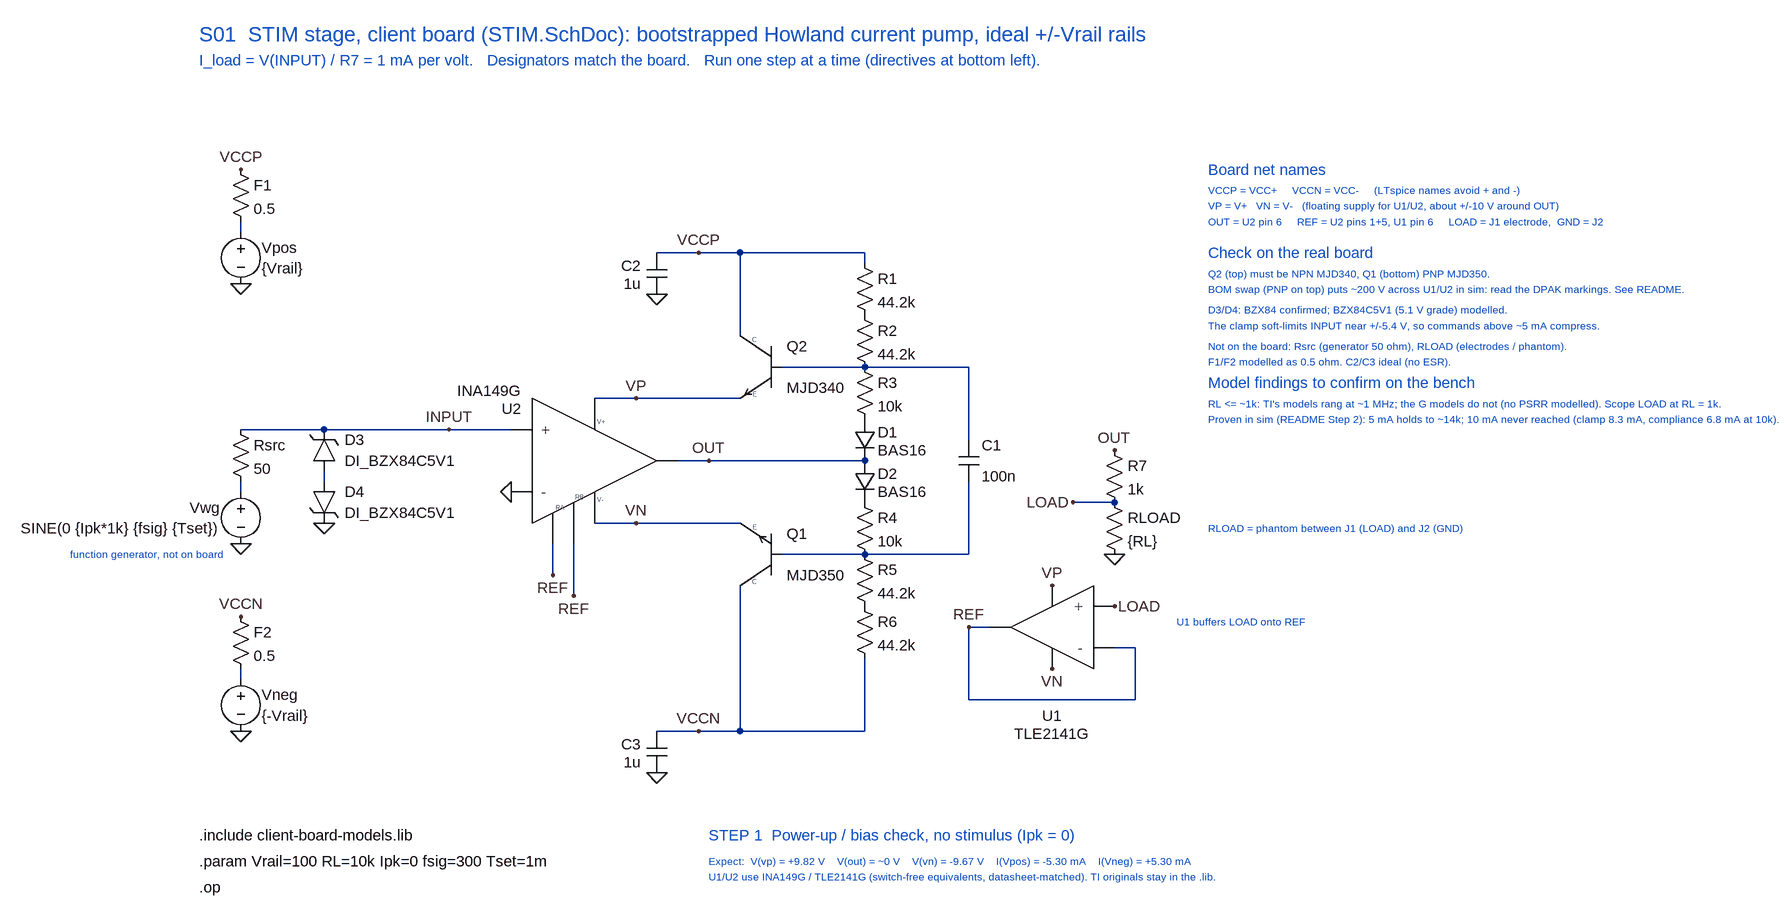
[diagram p0: schematic client-board-model.asc]
client-board-model.asc, the LTspice schematic file:
Version 4
SHEET 1 2400 1500
WIRE 0 -48 0 -32
WIRE 0 272 128 272
WIRE 128 272 320 272
WIRE 320 272 416 272
WIRE 0 352 0 368
WIRE 128 336 128 352
WIRE 0 640 0 656
WIRE 640 0 704 0
WIRE 704 0 768 0
WIRE 768 0 960 0
WIRE 768 0 768 128
WIRE 960 0 960 16
WIRE 640 736 704 736
WIRE 704 736 768 736
WIRE 768 736 960 736
WIRE 768 512 768 736
WIRE 960 624 960 736
WIRE 832 176 960 176
WIRE 832 464 960 464
WIRE 960 176 1120 176
WIRE 1120 176 1120 288
WIRE 1120 352 1120 464
WIRE 1120 464 960 464
WIRE 544 224 608 224
WIRE 608 224 768 224
WIRE 544 416 608 416
WIRE 608 416 768 416
WIRE 672 320 720 320
WIRE 720 320 960 320
WIRE 480 448 480 496
WIRE 512 448 512 528
WIRE 1344 384 1280 384
WIRE 1152 576 1120 576
WIRE 1120 576 1120 688
WIRE 1120 688 1376 688
WIRE 1376 688 1376 608
WIRE 1376 608 1344 608
FLAG 0 -128 VCCP
FLAG 0 48 0
FLAG 320 272 INPUT
FLAG 0 448 0
FLAG 128 416 0
FLAG 0 560 VCCN
FLAG 0 736 0
FLAG 704 0 VCCP
FLAG 640 64 0
FLAG 704 736 VCCN
FLAG 640 800 0
FLAG 416 368 0
FLAG 480 496 REF
FLAG 512 528 REF
FLAG 608 224 VP
FLAG 608 416 VN
FLAG 720 320 OUT
FLAG 1344 304 OUT
FLAG 1280 384 LOAD
FLAG 1344 464 0
FLAG 1344 544 LOAD
FLAG 1248 512 VP
FLAG 1248 640 VN
FLAG 1120 576 REF
SYMBOL res -16 -144 R0
WINDOW 0 36 40 Left 2
WINDOW 3 36 76 Left 2
SYMATTR InstName F1
SYMATTR Value 0.5
SYMBOL voltage 0 -48 R0
WINDOW 0 32 40 Left 2
WINDOW 3 32 72 Left 2
SYMATTR InstName Vpos
SYMATTR Value {Vrail}
SYMBOL res -16 256 R0
WINDOW 0 36 40 Left 2
WINDOW 3 36 76 Left 2
SYMATTR InstName Rsrc
SYMATTR Value 50
SYMBOL voltage 0 352 R0
WINDOW 0 -32 40 Right 2
WINDOW 3 -32 72 Right 2
SYMATTR InstName Vwg
SYMATTR Value SINE(0 {Ipk*1k} {fsig} {Tset})
SYMBOL zener_ka 112 272 R0
WINDOW 0 48 16 Left 2
WINDOW 3 48 48 Left 2
SYMATTR InstName D3
SYMATTR Value DI_BZX84C5V1
SYMBOL zener_ak 112 352 R0
WINDOW 0 48 16 Left 2
WINDOW 3 48 48 Left 2
SYMATTR InstName D4
SYMATTR Value DI_BZX84C5V1
SYMBOL res -16 544 R0
WINDOW 0 36 40 Left 2
WINDOW 3 36 76 Left 2
SYMATTR InstName F2
SYMATTR Value 0.5
SYMBOL voltage 0 640 R0
WINDOW 0 32 40 Left 2
WINDOW 3 32 72 Left 2
SYMATTR InstName Vneg
SYMATTR Value {-Vrail}
SYMBOL cap 624 0 R0
WINDOW 0 -8 20 Right 2
WINDOW 3 -8 48 Right 2
SYMATTR InstName C2
SYMATTR Value 1u
SYMBOL cap 624 736 R0
WINDOW 0 -8 20 Right 2
WINDOW 3 -8 48 Right 2
SYMATTR InstName C3
SYMATTR Value 1u
SYMBOL npn_r 768 128 R0
WINDOW 0 72 16 Left 2
WINDOW 3 72 80 Left 2
SYMATTR InstName Q2
SYMATTR Value MJD340
SYMBOL pnp_r 768 416 R0
WINDOW 0 72 16 Left 2
WINDOW 3 72 80 Left 2
SYMATTR InstName Q1
SYMATTR Value MJD350
SYMBOL res 944 0 R0
WINDOW 0 36 40 Left 2
WINDOW 3 36 76 Left 2
SYMATTR InstName R1
SYMATTR Value 44.2k
SYMBOL res 944 80 R0
WINDOW 0 36 40 Left 2
WINDOW 3 36 76 Left 2
SYMATTR InstName R2
SYMATTR Value 44.2k
SYMBOL res 944 160 R0
WINDOW 0 36 40 Left 2
WINDOW 3 36 76 Left 2
SYMATTR InstName R3
SYMATTR Value 10k
SYMBOL diode 944 256 R0
WINDOW 0 36 20 Left 2
WINDOW 3 36 48 Left 2
SYMATTR InstName D1
SYMATTR Value BAS16
SYMBOL diode 944 320 R0
WINDOW 0 36 20 Left 2
WINDOW 3 36 48 Left 2
SYMATTR InstName D2
SYMATTR Value BAS16
SYMBOL res 944 368 R0
WINDOW 0 36 40 Left 2
WINDOW 3 36 76 Left 2
SYMATTR InstName R4
SYMATTR Value 10k
SYMBOL res 944 448 R0
WINDOW 0 36 40 Left 2
WINDOW 3 36 76 Left 2
SYMATTR InstName R5
SYMATTR Value 44.2k
SYMBOL res 944 528 R0
WINDOW 0 36 40 Left 2
WINDOW 3 36 76 Left 2
SYMATTR InstName R6
SYMATTR Value 44.2k
SYMBOL cap 1104 288 R0
WINDOW 0 36 8 Left 2
WINDOW 3 36 56 Left 2
SYMATTR InstName C1
SYMATTR Value 100n
SYMBOL INA149 448 320 R0
WINDOW 0 -16 -80 Right 2
WINDOW 3 -16 -108 Right 2
SYMATTR InstName U2
SYMATTR Value INA149G
SYMBOL res 1328 288 R0
WINDOW 0 36 40 Left 2
WINDOW 3 36 76 Left 2
SYMATTR InstName R7
SYMATTR Value 1k
SYMBOL res 1328 368 R0
WINDOW 0 36 40 Left 2
WINDOW 3 36 76 Left 2
SYMATTR InstName RLOAD
SYMATTR Value {RL}
SYMBOL TLE2141 1184 576 R0
WINDOW 0 64 136 Center 2
WINDOW 3 64 164 Center 2
SYMATTR InstName U1
SYMATTR Value TLE2141G
TEXT -64 -336 Left 3 S01  STIM stage, client board (STIM.SchDoc): bootstrapped Howland current pump, ideal +/-Vrail rails
TEXT -64 -296 Left 2 I_load = V(INPUT) / R7 = 1 mA per volt.   Designators match the board.   Run one step at a time (directives at bottom left).
TEXT 1488 -128 Left 2 Board net names
TEXT 1488 -96 Left 1 VCCP = VCC+     VCCN = VCC-     (LTspice names avoid + and -)
TEXT 1488 -72 Left 1 VP = V+   VN = V-   (floating supply for U1/U2, about +/-10 V around OUT)
TEXT 1488 -48 Left 1 OUT = U2 pin 6     REF = U2 pins 1+5, U1 pin 6     LOAD = J1 electrode,  GND = J2
TEXT 1488 0 Left 2 Check on the real board
TEXT 1488 32 Left 1 Q2 (top) must be NPN MJD340, Q1 (bottom) PNP MJD350.
TEXT 1488 56 Left 1 BOM swap (PNP on top) puts ~200 V across U1/U2 in sim: read the DPAK markings. See README.
TEXT 1488 88 Left 1 D3/D4: BZX84 confirmed; BZX84C5V1 (5.1 V grade) modelled.
TEXT 1488 112 Left 1 The clamp soft-limits INPUT near +/-5.4 V, so commands above ~5 mA compress.
TEXT 1488 144 Left 1 Not on the board: Rsrc (generator 50 ohm), RLOAD (electrodes / phantom).
TEXT 1488 168 Left 1 F1/F2 modelled as 0.5 ohm. C2/C3 ideal (no ESR).
TEXT 1488 200 Left 2 Model findings to confirm on the bench
TEXT 1488 232 Left 1 RL <= ~1k: TI's models rang at ~1 MHz; the G models do not (no PSRR modelled). Scope LOAD at RL = 1k.
TEXT 1488 256 Left 1 Proven in sim (README Step 2): 5 mA holds to ~14k; 10 mA never reached (clamp 8.3 mA, compliance 6.8 mA at 10k).
TEXT -32 464 Right 1 function generator, not on board
TEXT 1488 424 Left 1 RLOAD = phantom between J1 (LOAD) and J2 (GND)
TEXT 1440 568 Left 1 U1 buffers LOAD onto REF
TEXT -64 896 Left 2 !.include client-board-models.lib
TEXT -64 936 Left 2 !.param Vrail=100 RL=10k Ipk=0 fsig=300 Tset=1m
TEXT -64 976 Left 2 !.op
TEXT 720 896 Left 2 STEP 1  Power-up / bias check, no stimulus (Ipk = 0)
TEXT 720 936 Left 1 Expect:  V(vp) = +9.82 V    V(out) = ~0 V    V(vn) = -9.67 V    I(Vpos) = -5.30 mA    I(Vneg) = +5.30 mA
TEXT 720 960 Left 1 U1/U2 use INA149G / TLE2141G (switch-free equivalents, datasheet-matched). TI originals stay in the .lib.

The netlist it stands for:
* client-board-model.asc
R§F1 VCCP N001 0.5
Vpos N001 0 {Vrail}
Rsrc INPUT N002 50
Vwg N002 0 SINE(0 {Ipk*1k} {fsig} {Tset})
XD3 N003 INPUT DI_BZX84C5V1  ; pins A K
XD4 N003 0 DI_BZX84C5V1  ; pins A K
R§F2 VCCN N004 0.5
Vneg N004 0 {-Vrail}
C2 VCCP 0 1u
C3 VCCN 0 1u
Q2 VCCP N005 VP 0 MJD340
Q1 VCCN N006 VN 0 MJD350
R1 VCCP P001 44.2k
R2 P001 N005 44.2k
R3 N005 P002 10k
D1 P002 OUT BAS16
D2 OUT P003 BAS16
R4 P003 N006 10k
R5 N006 P004 44.2k
R6 P004 VCCN 44.2k
C1 N005 N006 100n
XU2 INPUT 0 REF REF VP VN OUT INA149G  ; pins +IN -IN REF_A REF_B V+ V- VOUT
R7 OUT LOAD 1k
RLOAD LOAD 0 {RL}
XU1 LOAD REF VP VN REF TLE2141G  ; pins IN+ IN- VCC VEE OUT
.model D D
.lib standard.dio
.model NPN NPN
.model PNP PNP
.lib standard.bjt
* S01  STIM stage, client board (STIM.SchDoc): bootstrapped Howland current pump, ideal +/-Vrail rails
* I_load = V(INPUT) / R7 = 1 mA per volt.   Designators match the board.   Run one step at a time (directives at bottom left).
* Board net names
* VCCP = VCC+     VCCN = VCC-     (LTspice names avoid + and -)
* VP = V+   VN = V-   (floating supply for U1/U2, about +/-10 V around OUT)
* OUT = U2 pin 6     REF = U2 pins 1+5, U1 pin 6     LOAD = J1 electrode,  GND = J2
* Check on the real board
* Q2 (top) must be NPN MJD340, Q1 (bottom) PNP MJD350.
* BOM swap (PNP on top) puts ~200 V across U1/U2 in sim: read the DPAK markings. See README.
* D3/D4: BZX84 confirmed; BZX84C5V1 (5.1 V grade) modelled.
* The clamp soft-limits INPUT near +/-5.4 V, so commands above ~5 mA compress.
* Not on the board: Rsrc (generator 50 ohm), RLOAD (electrodes / phantom).
* F1/F2 modelled as 0.5 ohm. C2/C3 ideal (no ESR).
* Model findings to confirm on the bench
* RL <= ~1k: TI's models rang at ~1 MHz; the G models do not (no PSRR modelled). Scope LOAD at RL = 1k.
* Proven in sim (README Step 2): 5 mA holds to ~14k; 10 mA never reached (clamp 8.3 mA, compliance 6.8 mA at 10k).
* function generator, not on board
* RLOAD = phantom between J1 (LOAD) and J2 (GND)
* U1 buffers LOAD onto REF
.include client-board-models.lib
.param Vrail=100 RL=10k Ipk=0 fsig=300 Tset=1m
.op
* STEP 1  Power-up / bias check, no stimulus (Ipk = 0)
* Expect:  V(vp) = +9.82 V    V(out) = ~0 V    V(vn) = -9.67 V    I(Vpos) = -5.30 mA    I(Vneg) = +5.30 mA
* U1/U2 use INA149G / TLE2141G (switch-free equivalents, datasheet-matched). TI originals stay in the .lib.
.backanno
.end